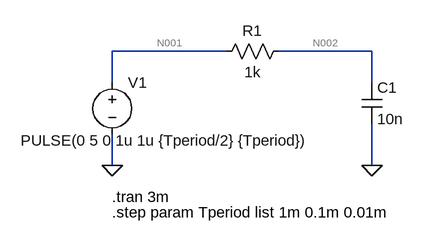
[diagram p0: schematic Pulso.asc]
Pulso.asc, the LTspice schematic file:
Version 4.1
SHEET 1 880 680
WIRE 272 96 96 96
WIRE 496 96 352 96
WIRE 96 144 96 96
WIRE 496 144 496 96
WIRE 96 272 96 224
WIRE 496 272 496 208
FLAG 96 272 0
FLAG 496 272 0
SYMBOL voltage 96 128 R0
WINDOW 3 -141 105 Left 2
WINDOW 123 0 0 Left 0
WINDOW 39 0 0 Left 0
SYMATTR InstName V1
SYMATTR Value PULSE(0 5 0 1u 1u {Tperiod/2} {Tperiod})
SYMBOL res 368 80 R90
WINDOW 0 0 56 VBottom 2
WINDOW 3 32 56 VTop 2
SYMATTR InstName R1
SYMATTR Value 1k
SYMBOL cap 480 144 R0
SYMATTR InstName C1
SYMATTR Value 10n
TEXT 96 320 Left 2 !.tran 3m
TEXT 96 344 Left 2 !.step param Tperiod list 1m 0.1m 0.01m

The netlist it stands for:
* Pulso.asc
V1 N001 0 PULSE(0 5 0 1u 1u {Tperiod/2} {Tperiod})
R1 N002 N001 1k
C1 N002 0 10n
.tran 3m
.step param Tperiod list 1m 0.1m 0.01m
.backanno
.end

* Results of the author's LTspice run, read from the files saved beside the schematic
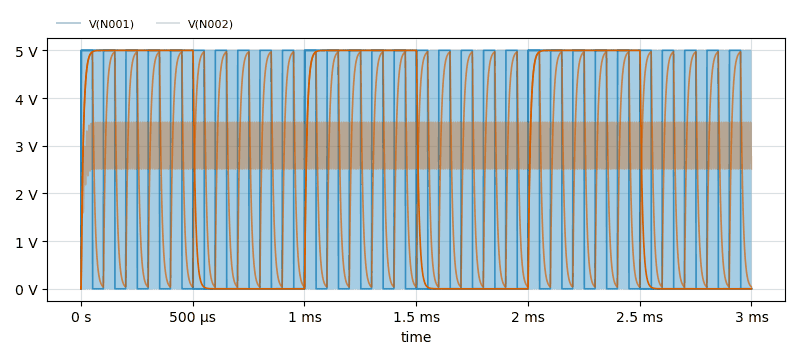
[diagram p1: Transient Analysis of Pulso.asc, plotted from the saved traces]
* Transient Analysis, 3 runs:
*   V(N001) [tperiod=1e-05]: min 0 V, max 5 V, average 3 V, rms 3.871 V, last 0 V
*   V(N001) [tperiod=0.0001]: min 0 V, max 5 V, average 2.55 V, rms 3.568 V, last 0 V
*   V(N001) [tperiod=0.001]: min 0 V, max 5 V, average 2.505 V, rms 3.539 V, last 0 V
*   V(N002) [tperiod=1e-05]: min 0 V, max 3.495 V, average 2.992 V, rms 3.014 V, last 2.517 V
*   V(N002) [tperiod=0.0001]: min 0 V, max 4.969 V, average 2.55 V, rms 3.21 V, last 37.75 mV
*   V(N002) [tperiod=0.001]: min 0 V, max 5 V, average 2.505 V, rms 3.504 V, last 0 V